# Altium schematic sheet Pantalla_microSD.SchDoc
size A; SheetNumber: 4; SheetTotal: 6
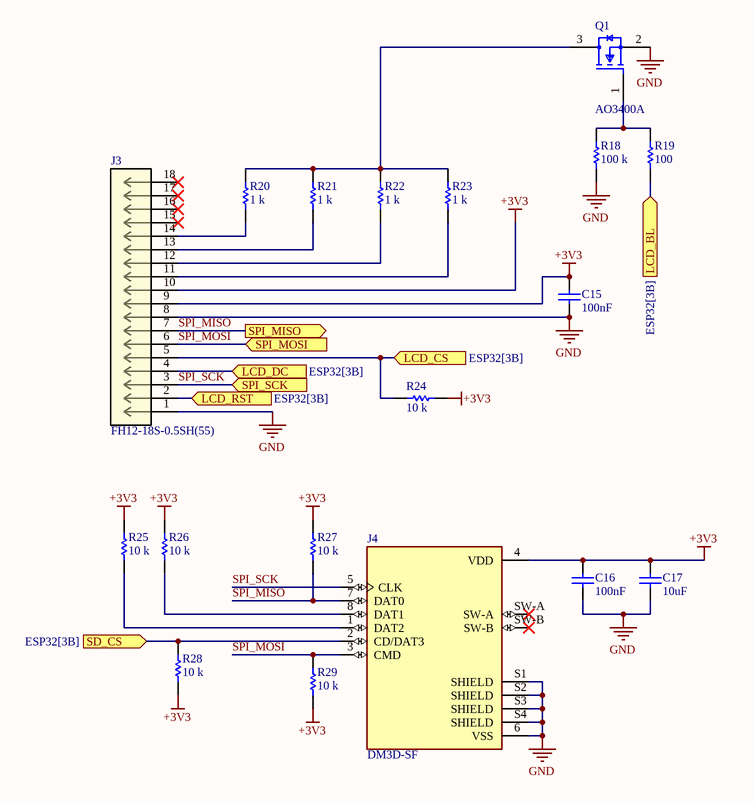
[diagram p0: Pantalla_microSD.SchDoc]

## Parts
C15  value 100nF  [CAP 1206_3216]  (hidden comment: Capacitor)
C16  value 100nF  [CAP 1206_3216]  (hidden comment: Capacitor)
C17  value 10uF  [CAP 1206_3216]  (hidden comment: Capacitor)
J3  FH12-18S-0.5SH(55)  [CONN_FH12-18S-0.5SH-55_HIR]
J4  DM3D-SF  [HRS_DM3D-SF]
Q1  AO3400A  [FP-SOT23-MFG]
R18  value 100 k  [RES 0805_2012]  (hidden comment: Resistor)
R19  value 100  [RES 0805_2012]  (hidden comment: Resistor)
R20  value 1 k  [RES 0805_2012]  (hidden comment: Resistor)
R21  value 1 k  [RES 0805_2012]  (hidden comment: Resistor)
R22  value 1 k  [RES 0805_2012]  (hidden comment: Resistor)
R23  value 1 k  [RES 0805_2012]  (hidden comment: Resistor)
R24  value 10 k  [RES 0805_2012]  (hidden comment: Resistor)
R25  value 10 k  [RES 0805_2012]  (hidden comment: Resistor)
R26  value 10 k  [RES 0805_2012]  (hidden comment: Resistor)
R27  value 10 k  [RES 0805_2012]  (hidden comment: Resistor)
R28  value 10 k  [RES 0805_2012]  (hidden comment: Resistor)
R29  value 10 k  [RES 0805_2012]  (hidden comment: Resistor)

## Ports
LCD_BL (in, see ESP32[3B]), LCD_CS (in, see ESP32[3B]), LCD_DC (in, see ESP32[3B]), LCD_RST (in, see ESP32[3B]), SD_CS (in, see ESP32[3B]), SPI_MISO (out, see ESP32[3B]), SPI_MOSI (in, see ESP32[3B]), SPI_SCK (in, see ESP32[3B])

## Nets
+3V3: C15.2 C16.2 C17.2 J3.9 J3.10 J4.4(VDD) R24.2 R25.1 R26.1 R27.2 R28.2 R29.2
GND: C15.1 C16.1 C17.1 J3.1 J3.8 J4.6(VSS) J4.S1(SHIELD) J4.S2(SHIELD) J4.S3(SHIELD) J4.S4(SHIELD) Q1.2(S) R18.1
LCD_BL: R19.1 ; port LCD_BL
LCD_CS: J3.5 R24.1 ; port LCD_CS
LCD_DC: J3.4 ; port LCD_DC
LCD_RST: J3.2 ; port LCD_RST
SD_CS: J4.2(CD/DAT3) R28.1 ; port SD_CS
SPI_MISO: J3.7 J4.7(DAT0) R27.1 ; port SPI_MISO
SPI_MOSI: J3.6 J4.3(CMD) R29.1 ; port SPI_MOSI
SPI_SCK: J3.3 J4.5(CLK) ; port SPI_SCK
NetJ3_11: J3.11 R23.1
NetJ3_12: J3.12 R22.1
NetJ3_13: J3.13 R21.1
NetJ3_14: J3.14 R20.1
NetJ4_1: J4.1(DAT2) R25.2
NetJ4_8: J4.8(DAT1) R26.2
NetQ1_1: Q1.1(G) R18.2 R19.2
NetQ1_3: Q1.3(D) R20.2 R21.2 R22.2 R23.2

Not connected (* = marked no-connect by the designer): J3 15* 16* 17* 18*; J4 SW-A* SW-B*

## Notes on the sheet
- Title:
- Date:
- Size:
- A3
- Number:
- Institution:
- Universidad Anáhuac Querétaro
- Drawn by:
- Marco Antonio Guereca Soto
- Check by:
- Morrison Ernesto Rodríguez Gutiérrez

## Library data of the parts
C15-C17 = Capacitor: SimulationGenericComponent: True
J3 = FH12-18S-0.5SH55: Description; Manufacturer_Name: Hirose; Copyright: Copyright (C) 2026 Ultra Librarian. All rights reserved.; Manufacturer_Part_Number: FH12-18S-0.5SH(55); RefDes: RefDes; Type: Type
J4 = DM3D-SF: 10 _8 + 2_ Position Card Connector Secure Digital - microSDâ„¢ Surface Mount, Right Angle Gold; MF: Hirose Electric; MP: DM3D-SF; Package: None; Price: None; Availability: Unavailable; SnapEDA_Link: https://www.snapeda.com/parts/DM3D-SF/Hirose%20Electric%20Co%20Ltd/view-part/250106/?ref=snap; Value: *
Q1 = CMP-83955-000006-1: MOSFET N-CH 30V 5.7A SOT23; Input Capacitance: 630pF; Number of Elements: 1; Rds On Max: 26.5mR; Max Power Dissipation: 1.4W; Gate to Source Voltage (Vgs): 12V; Min Operating Temperature: -55°C; Lead Free: Lead Free; Number of Pins: 3; Drain to Source Voltage (Vdss): 30V; Case/Package: SOT-23; Mount: Surface Mount; Continuous Drain Current (ID): 5.7A; Radiation Hardening: No; Packaging: Tape and Reel; Max Operating Temperature: 150°C; Power Dissipation: 1.4W
R18-R29 = Resistor: TC1: 0; SimulationGenericComponent: True; TC2: 0